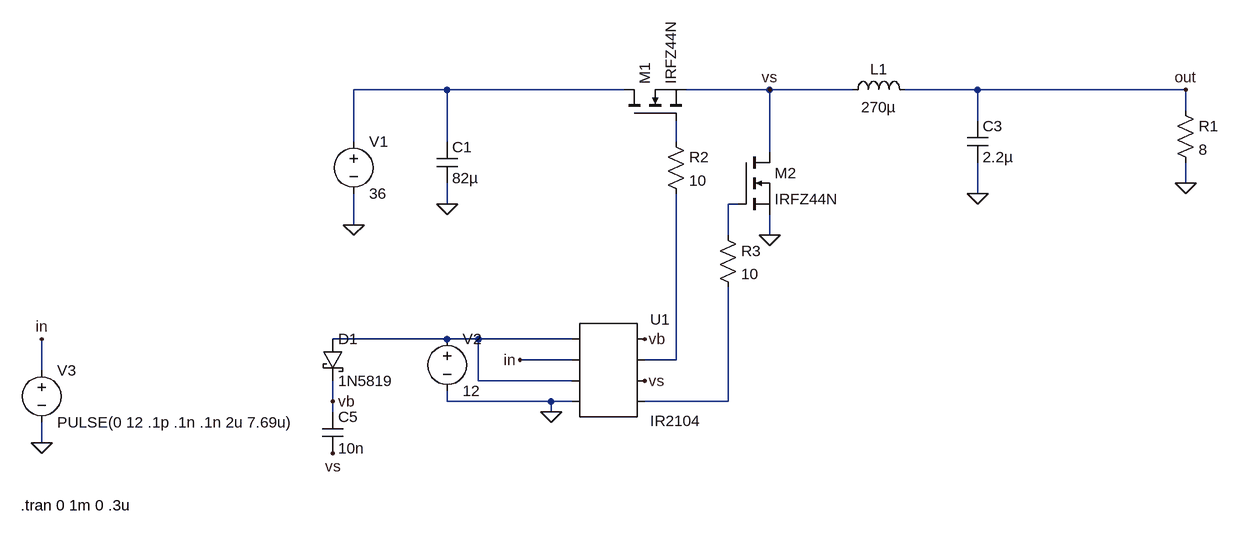
[diagram p0: schematic Draft1.asc]
Draft1.asc, the LTspice schematic file:
Version 4
SHEET 1 1048 680
WIRE -144 -16 -288 -16
WIRE 128 -16 -144 -16
WIRE 352 -16 224 -16
WIRE 480 -16 352 -16
WIRE 672 -16 560 -16
WIRE 992 -16 672 -16
WIRE 992 16 992 -16
WIRE 672 32 672 -16
WIRE -288 64 -288 -16
WIRE -144 64 -144 -16
WIRE 208 64 208 32
WIRE 352 80 352 -16
WIRE 992 128 992 96
WIRE 672 144 672 96
WIRE -144 160 -144 128
WIRE 304 160 288 160
WIRE -288 192 -288 144
WIRE 288 208 288 160
WIRE 352 208 352 176
WIRE -144 368 -320 368
WIRE -96 368 -144 368
WIRE 48 368 -96 368
WIRE 48 400 -32 400
WIRE 208 400 208 144
WIRE 208 400 160 400
WIRE -768 416 -768 368
WIRE -96 432 -96 368
WIRE 48 432 -96 432
WIRE -320 464 -320 432
WIRE -144 464 -144 448
WIRE 16 464 -144 464
WIRE 48 464 16 464
WIRE 288 464 288 288
WIRE 288 464 160 464
WIRE -320 480 -320 464
WIRE 16 480 16 464
WIRE -768 528 -768 496
FLAG -288 192 0
FLAG -144 160 0
FLAG 672 144 0
FLAG 992 128 0
FLAG 352 208 0
FLAG 16 480 0
FLAG -32 400 in
FLAG -320 464 vb
FLAG 160 368 vb
FLAG 160 432 vs
FLAG -320 544 vs
FLAG 352 -16 vs
FLAG -768 528 0
FLAG -768 368 in
FLAG 992 -16 out
SYMBOL voltage -288 48 R0
WINDOW 123 0 0 Left 0
WINDOW 39 0 0 Left 0
SYMATTR InstName V1
SYMATTR Value 36
SYMBOL cap -160 64 R0
SYMATTR InstName C1
SYMATTR Value 82µ
SYMBOL nmos 128 32 R270
SYMATTR InstName M1
SYMATTR Value IRFZ44N
SYMBOL nmos 304 80 R0
SYMATTR InstName M2
SYMATTR Value IRFZ44N
SYMBOL ind 464 0 R270
WINDOW 0 32 56 VTop 2
WINDOW 3 5 56 VBottom 2
SYMATTR InstName L1
SYMATTR Value 270µ
SYMBOL cap 656 32 R0
SYMATTR InstName C3
SYMATTR Value 2.2µ
SYMBOL res 976 0 R0
SYMATTR InstName R1
SYMATTR Value 8
SYMBOL res 192 48 R0
SYMATTR InstName R2
SYMATTR Value 10
SYMBOL res 272 192 R0
SYMATTR InstName R3
SYMATTR Value 10
SYMBOL AutoGenerated\\IR2104 96 416 R0
SYMATTR InstName U1
SYMBOL voltage -144 352 R0
WINDOW 123 0 0 Left 0
WINDOW 39 0 0 Left 0
SYMATTR InstName V2
SYMATTR Value 12
SYMBOL schottky -336 368 R0
SYMATTR InstName D1
SYMATTR Value 1N5819
SYMBOL cap -336 480 R0
SYMATTR InstName C5
SYMATTR Value 10n
SYMBOL voltage -768 400 R0
WINDOW 123 0 0 Left 0
WINDOW 39 0 0 Left 0
SYMATTR InstName V3
SYMATTR Value PULSE(0 12 .1p .1n .1n 2u 7.69u)
TEXT -800 624 Left 2 !.tran 0 1m 0 .3u

The netlist it stands for:
* Draft1.asc
V1 N001 0 36
C1 N001 0 82µ
M1 N001 N002 vs vs IRFZ44N
M2 vs N003 0 0 IRFZ44N
L1 vs out 270µ
C3 out 0 2.2µ
R1 out 0 8
R2 N002 N005 10
R3 N003 N006 10
* U1: IR2104 (symbol AutoGenerated\IR2104 not available, pins judged from their places): pin1=N004 pin2=in pin3=N004 pin4=0 pin5=vb pin6=N005 pin7=vs pin8=N006
V2 N004 0 12
D1 N004 vb 1N5819
C5 vb vs 10n
V3 in 0 PULSE(0 12 .1p .1n .1n 2u 7.69u)
.model D D
.lib standard.dio
.model NMOS NMOS
.model PMOS PMOS
.lib standard.mos
.tran 0 1m 0 .3u
.backanno
.end